# Altium schematic sheet Audio.SchDoc
size A4; SheetNumber: 3; SheetTotal: 4
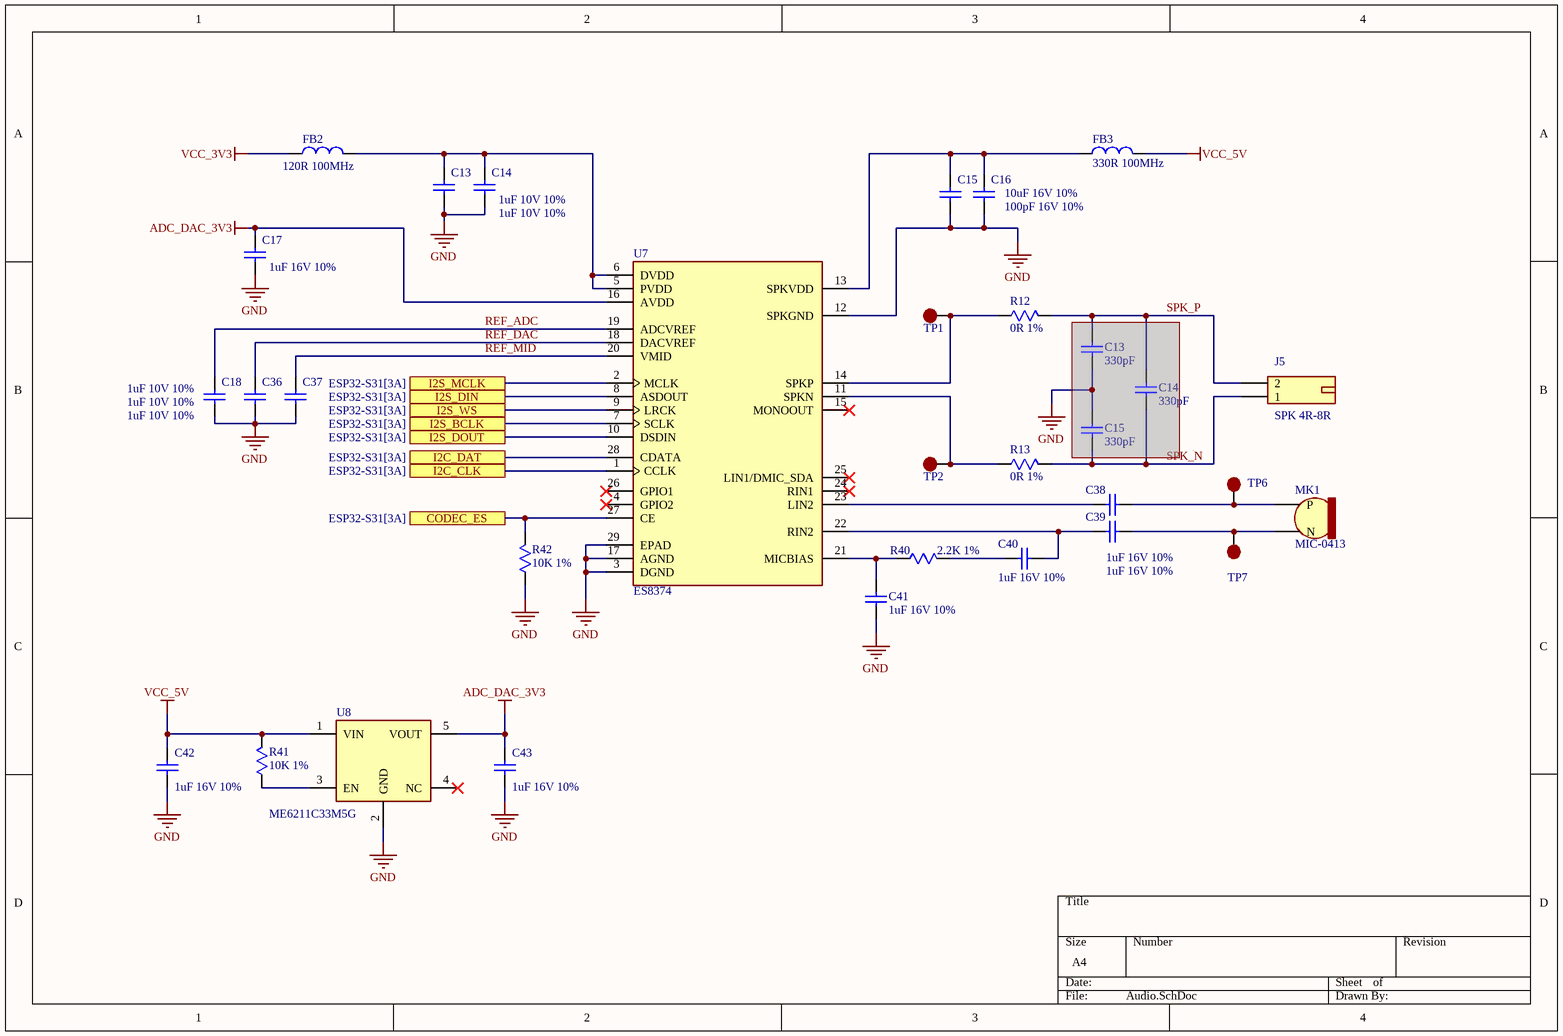
[diagram p0: Audio.SchDoc]

## Parts
(Parts that share a designator on the sheet are numbered #1, #2 ... from top to bottom, then left to right.)
C13#1  1uF 10V 10%  [C0402]
C13#2  330pF  [C0603]  (masked out: inside a compile mask, not in the netlist)
C14#1  1uF 10V 10%  [C0402]
C14#2  330pF  [C0603]  (masked out: inside a compile mask, not in the netlist)
C15#1  100pF 16V 10%  [C0402]
C15#2  330pF  [C0603]  (masked out: inside a compile mask, not in the netlist)
C16  10uF 16V 10%  [C0603]
C17  1uF 16V 10%  [C0402]
C18  1uF 10V 10%  [C0402]
C36  1uF 10V 10%  [C0402]
C37  1uF 10V 10%  [C0402]
C38  1uF 16V 10%  [C0402]
C39  1uF 16V 10%  [C0402]
C40  1uF 16V 10%  [C0402]
C41  1uF 16V 10%  [C0402]
C42  1uF 16V 10%  [C0402]
C43  1uF 16V 10%  [C0402]
FB2  120R 100MHz  [L0603]
FB3  330R 100MHz  [L0603]
J5  SPK 4R-8R  [JST_S2B-PH-SM4-TB(LF)(SN)]
MK1  MIC-0413  [MIC_CMEJ-0413-42-SMT-TR]
R12  0R 1%  [R0603]
R13  0R 1%  [R0603]
R40  2.2K 1%  [R0402]
R41  10K 1%  [R0402]
R42  10K 1%  [R0402]
TP1  Test point  [TP]  (value not drawn)
TP2  Test point  [TP]  (value not drawn)
TP6  Test point  [TP]  (value not drawn)
TP7  Test point  [TP]  (value not drawn)
U7  ES8374  [QFN-28]
U8  ME6211C33M5G  [SOT23-5]

## Ports
CODEC_ES (see ESP32-S31[3A]), I2C_CLK (see ESP32-S31[3A]), I2C_DAT (see ESP32-S31[3A]), I2S_BCLK (see ESP32-S31[3A]), I2S_DIN (see ESP32-S31[3A]), I2S_DOUT (see ESP32-S31[3A]), I2S_MCLK (see ESP32-S31[3A]), I2S_WS (see ESP32-S31[3A])

## Nets
ADC_DAC_3V3: C17.1 C43.1 U7.16(AVDD) U8.5(VOUT)
GND: C13#1.2 C14#1.2 C15#1.2 C16.2 C17.2 C18.2 C36.2 C37.2 C41.2 C42.2 C43.2 R42.1 U7.3(DGND) U7.12(SPKGND) U7.17(AGND) U7.29(EPAD) U8.2(GND)
VCC_3V3: FB2.1
VCC_5V: C42.1 FB3.1 R41.2 U8.1(VIN)
CODEC_ES: R42.2 U7.27(CE) ; port CODEC_ES
I2C_CLK: U7.1(CCLK) ; port I2C_CLK
I2C_DAT: U7.28(CDATA) ; port I2C_DAT
I2S_BCLK: U7.7(SCLK) ; port I2S_BCLK
I2S_DIN: U7.8(ASDOUT) ; port I2S_DIN
I2S_DOUT: U7.10(DSDIN) ; port I2S_DOUT
I2S_MCLK: U7.2(MCLK) ; port I2S_MCLK
I2S_WS: U7.9(LRCK) ; port I2S_WS
REF_ADC: C18.1 U7.19(ADCVREF)
REF_DAC: C36.1 U7.18(DACVREF)
REF_MID: C37.1 U7.20(VMID)
SPK_N: J5.1 R13.2
SPK_P: J5.2 R12.2
NetC13#1_1: C13#1.1 C14#1.1 FB2.2 U7.5(PVDD) U7.6(DVDD)
NetC15#1_1: C15#1.1 C16.1 FB3.2 U7.13(SPKVDD)
NetC38_1: C38.1 MK1.1(P) TP6.1(EPAD)
NetC38_2: C38.2 U7.23(LIN2)
NetC39_1: C39.1 MK1.2(N) TP7.1(EPAD)
NetC39_2: C39.2 C40.1 U7.22(RIN2)
NetC40_2: C40.2 R40.2
NetC41_1: C41.1 R40.1 U7.21(MICBIAS)
NetR12_1: R12.1 TP1.1(EPAD) U7.14(SPKP)
NetR13_1: R13.1 TP2.1(EPAD) U7.11(SPKN)
NetR41_1: R41.1 U8.3(EN)

Not connected (* = marked no-connect by the designer): U7 4(GPIO2)* 15(MONOOUT)* 24(RIN1)* 25(LIN1/DMIC_SDA)* 26(GPIO1)*; U8 4(NC)*

## Library data of the parts
C13#1 C13#2 C14#1 C14#2 C15#1 C15#2 C16-C18 C36-C43 = Capacitor_Ceramic
FB2 FB3 = Ferrite-bead
J5 = CONNECTOR-2P
MK1 = MIC-0413: 4.0 mm, Omnidirectional, Surface Mount, 2.0 Vdc, Electret Condenser Microphone; MF: Same Sky; MP: CMEJ-0413-42-SMT-TR; SnapEDA_Link: https://www.snapeda.com/parts/CMEJ-0413-42-SMT-TR/Same+Sky/view-part/?ref=snap; Package: CUI Inc.; Value: *; Check_prices: https://www.snapeda.com/parts/CMEJ-0413-42-SMT-TR/Same+Sky/view-part/?ref=eda
R12 R13 R40-R42 = Resistor
U7 = ES8374: Low Power Mono Audio CODEC. 24-bit, 8 to 96 kHz sampling frequency, 95 dB signal to noise ratio.; MF: Everest Semiconductor; SnapEDA_Link: https://www.snapeda.com/parts/ES8374/Everest+Semiconductor/view-part/?ref=snap; Package: None; Value: *; MP: ES8374; Check_prices: https://www.snapeda.com/parts/ES8374/Everest+Semiconductor/view-part/?ref=eda
U8 = ME6211C33M5G: MF: Microne; SnapEDA_Link: https://www.snapeda.com/parts/ME6211C33M5G/Microne/view-part/?ref=snap; Package: None; Value: *; MP: ME6211C33M5G; Check_prices: https://www.snapeda.com/parts/ME6211C33M5G/Microne/view-part/?ref=eda